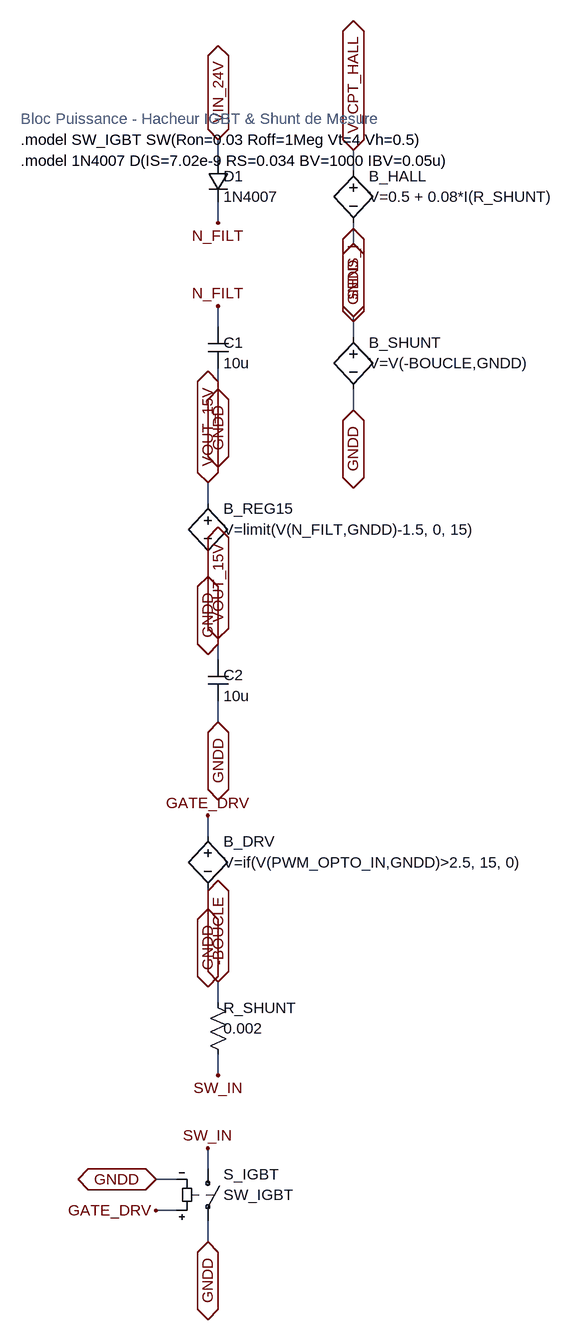
[diagram p0: schematic bloc_puissance.asc]
bloc_puissance.asc, the LTspice schematic file:
Version 4
SHEET 1 3200 2400
TEXT 32 32 Left 2 ;Bloc Puissance - Hacheur IGBT & Shunt de Mesure
TEXT 32 64 Left 2 !.model SW_IGBT SW(Ron=0.03 Roff=1Meg Vt=4 Vh=0.5)
TEXT 32 96 Left 2 !.model 1N4007 D(IS=7.02e-9 RS=0.034 BV=1000 IBV=0.05u)
SYMBOL diode 320 96 R0
WINDOW 0 24 24 Left 2
WINDOW 3 24 56 Left 2
SYMATTR InstName D1
SYMATTR Value 1N4007
WIRE 336 96 336 64
FLAG 336 64 VIN_24V
IOPIN 336 64 BiDir
WIRE 336 160 336 192
FLAG 336 192 N_FILT
SYMBOL cap 320 352 R0
WINDOW 0 24 24 Left 2
WINDOW 3 24 56 Left 2
SYMATTR InstName C1
SYMATTR Value 10u
WIRE 336 352 336 320
FLAG 336 320 N_FILT
WIRE 336 416 336 448
FLAG 336 448 GNDD
IOPIN 336 448 BiDir
SYMBOL bv 320 608 R0
WINDOW 0 24 24 Left 2
WINDOW 3 24 56 Left 2
SYMATTR InstName B_REG15
SYMATTR Value V=limit(V(N_FILT,GNDD)-1.5, 0, 15)
WIRE 320 624 320 592
FLAG 320 592 VOUT_15V
IOPIN 320 592 BiDir
WIRE 320 704 320 736
FLAG 320 736 GNDD
IOPIN 320 736 BiDir
SYMBOL cap 320 864 R0
WINDOW 0 24 24 Left 2
WINDOW 3 24 56 Left 2
SYMATTR InstName C2
SYMATTR Value 10u
WIRE 336 864 336 832
FLAG 336 832 VOUT_15V
IOPIN 336 832 BiDir
WIRE 336 928 336 960
FLAG 336 960 GNDD
IOPIN 336 960 BiDir
SYMBOL bv 320 1120 R0
WINDOW 0 24 24 Left 2
WINDOW 3 24 56 Left 2
SYMATTR InstName B_DRV
SYMATTR Value V=if(V(PWM_OPTO_IN,GNDD)>2.5, 15, 0)
WIRE 320 1136 320 1104
FLAG 320 1104 GATE_DRV
WIRE 320 1216 320 1248
FLAG 320 1248 GNDD
IOPIN 320 1248 BiDir
SYMBOL res 320 1376 R0
WINDOW 0 24 24 Left 2
WINDOW 3 24 56 Left 2
SYMATTR InstName R_SHUNT
SYMATTR Value 0.002
WIRE 336 1392 336 1360
FLAG 336 1360 -BOUCLE
IOPIN 336 1360 BiDir
WIRE 336 1472 336 1504
FLAG 336 1504 SW_IN
SYMBOL sw 320 1632 R0
WINDOW 0 24 24 Left 2
WINDOW 3 24 56 Left 2
SYMATTR InstName S_IGBT
SYMATTR Value SW_IGBT
WIRE 320 1648 320 1616
FLAG 320 1616 SW_IN
WIRE 320 1728 320 1760
FLAG 320 1760 GNDD
IOPIN 320 1760 BiDir
WIRE 272 1712 240 1712
FLAG 240 1712 GATE_DRV
WIRE 272 1664 240 1664
FLAG 240 1664 GNDD
IOPIN 240 1664 BiDir
SYMBOL bv 544 96 R0
WINDOW 0 24 24 Left 2
WINDOW 3 24 56 Left 2
SYMATTR InstName B_HALL
SYMATTR Value V=0.5 + 0.08*I(R_SHUNT)
WIRE 544 112 544 80
FLAG 544 80 V_CPT_HALL
IOPIN 544 80 BiDir
WIRE 544 192 544 224
FLAG 544 224 GNDD
IOPIN 544 224 BiDir
SYMBOL bv 544 352 R0
WINDOW 0 24 24 Left 2
WINDOW 3 24 56 Left 2
SYMATTR InstName B_SHUNT
SYMATTR Value V=V(-BOUCLE,GNDD)
WIRE 544 368 544 336
FLAG 544 336 SENS_I
IOPIN 544 336 BiDir
WIRE 544 448 544 480
FLAG 544 480 GNDD
IOPIN 544 480 BiDir

The netlist it stands for:
* bloc_puissance.asc
D1 VIN_24V N_FILT 1N4007
C1 N_FILT GNDD 10u
B_REG15 VOUT_15V GNDD V=limit(V(N_FILT,GNDD)-1.5, 0, 15)
C2 VOUT_15V GNDD 10u
B_DRV GATE_DRV GNDD V=if(V(PWM_OPTO_IN,GNDD)>2.5, 15, 0)
R_SHUNT -BOUCLE SW_IN 0.002
S_IGBT SW_IN GNDD GATE_DRV GNDD SW_IGBT
B_HALL V_CPT_HALL GNDD V=0.5 + 0.08*I(R_SHUNT)
B_SHUNT SENS_I GNDD V=V(-BOUCLE,GNDD)
.model D D
.lib standard.dio
* Bloc Puissance - Hacheur IGBT & Shunt de Mesure
.model SW_IGBT SW(Ron=0.03 Roff=1Meg Vt=4 Vh=0.5)
.model 1N4007 D(IS=7.02e-9 RS=0.034 BV=1000 IBV=0.05u)
.backanno
.end